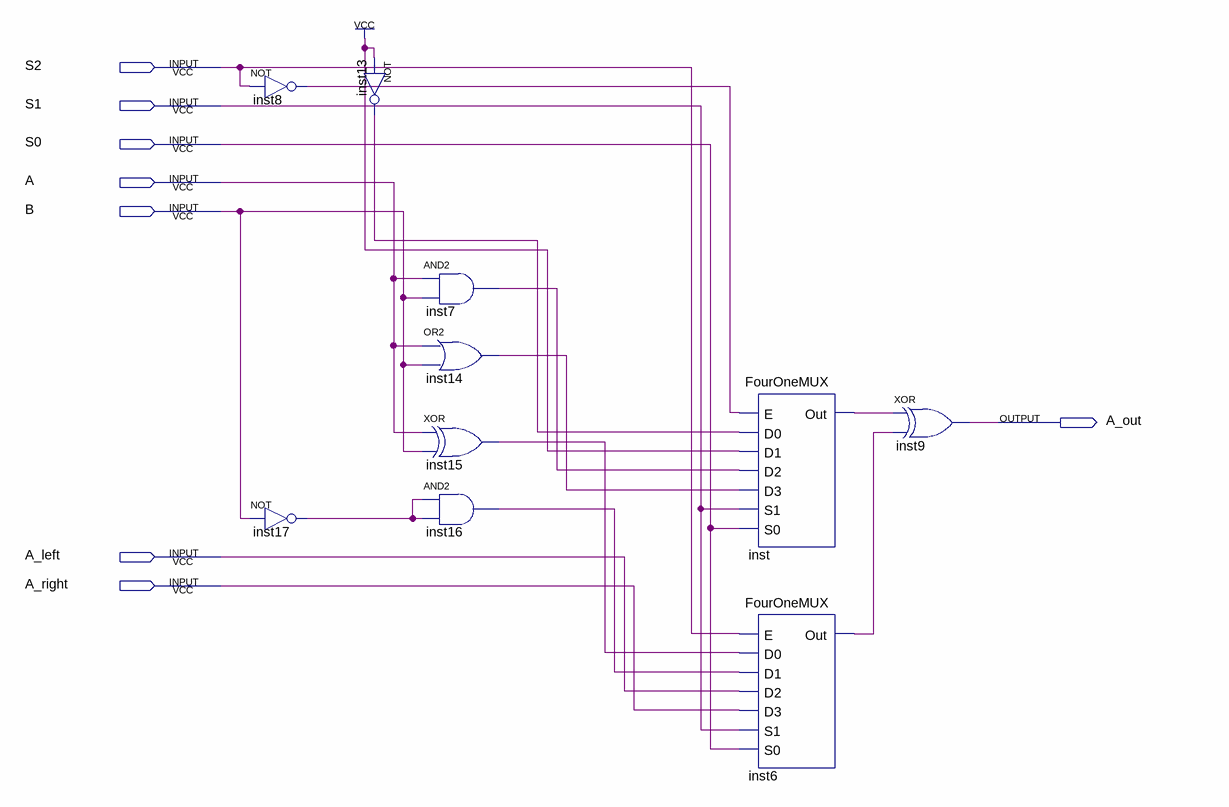
[diagram p0: schematic sheet]
// Quartus schematic 1bitLogicCircuit.bdf as structural Verilog: 10 symbols, 8 pins
module \1bitLogicCircuit  (
  input  S2,
  input  S1,
  input  S0,
  input  A,
  input  B,
  input  A_left,
  input  A_right,
  output A_out
);

  wire inst6_out, inst7_out, inst8_out, inst13_out, inst14_out, inst15_out, inst16_out, inst17_out, inst_out;

  not inst8 (inst8_out, S2);
  not inst17 (inst17_out, B);
  not inst13 (inst13_out, 1'b1);
  and inst7 (inst7_out, A, B);
  or inst14 (inst14_out, A, B);
  xor inst15 (inst15_out, A, B);
  and inst16 (inst16_out, inst17_out, inst17_out);
  FourOneMUX inst (
    .E(inst8_out), .D0(inst13_out), .D1(1'b1), .D2(inst7_out), .D3(inst14_out), .S1(S1), .S0(S0),
    .Out(inst_out));
  FourOneMUX inst6 (
    .E(S2), .D0(inst15_out), .D1(inst16_out), .D2(A_left), .D3(A_right), .S1(S1), .S0(S0), .Out(inst6_out));
  xor inst9 (A_out, inst_out, inst6_out);
endmodule
